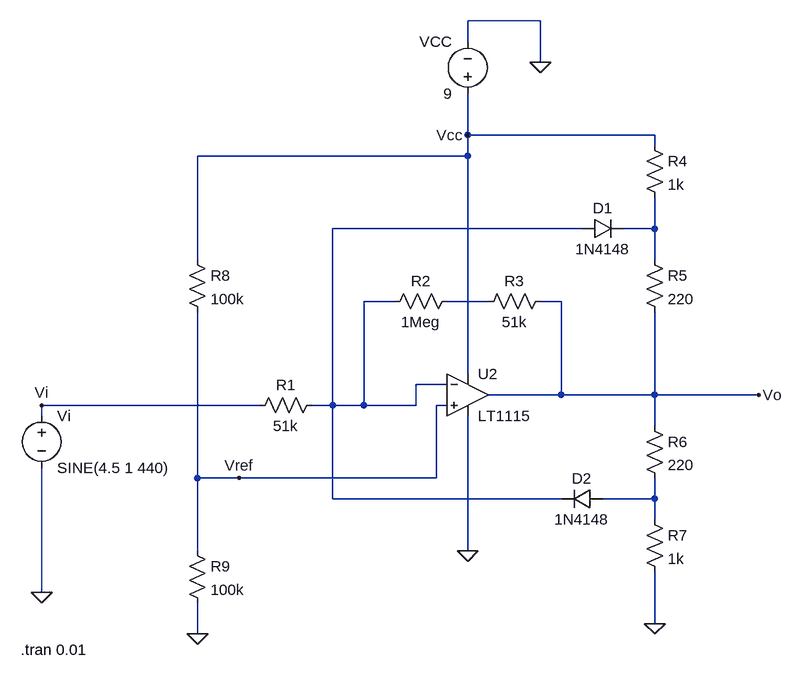
[diagram p0: schematic limiter_amp.asc]
limiter_amp.asc, the LTspice schematic file:
Version 4
SHEET 1 880 680
WIRE 288 -448 176 -448
WIRE 176 -416 176 -448
WIRE 288 -384 288 -448
WIRE 176 -272 176 -336
WIRE 464 -272 176 -272
WIRE 464 -256 464 -272
WIRE 176 -240 176 -272
WIRE 176 -240 -240 -240
WIRE 352 -128 -32 -128
WIRE 464 -128 464 -176
WIRE 464 -128 416 -128
WIRE -240 -80 -240 -240
WIRE 464 -80 464 -128
WIRE 64 -16 16 -16
WIRE 208 -16 144 -16
WIRE 320 -16 288 -16
WIRE 176 96 176 -240
WIRE 144 112 96 112
WIRE 320 128 320 -16
WIRE 320 128 208 128
WIRE 464 128 464 0
WIRE 464 128 320 128
WIRE 624 128 464 128
WIRE -144 144 -480 144
WIRE -32 144 -32 -128
WIRE -32 144 -64 144
WIRE 16 144 16 -16
WIRE 16 144 -32 144
WIRE 96 144 96 112
WIRE 96 144 16 144
WIRE 144 144 128 144
WIRE -480 160 -480 144
WIRE 464 176 464 128
WIRE -240 256 -240 0
WIRE -176 256 -240 256
WIRE 128 256 128 144
WIRE 128 256 -176 256
WIRE -32 288 -32 144
WIRE 320 288 -32 288
WIRE 464 288 464 256
WIRE 464 288 384 288
WIRE 464 320 464 288
WIRE -240 368 -240 256
WIRE 176 368 176 160
WIRE -480 432 -480 240
WIRE 464 480 464 400
WIRE -240 496 -240 448
FLAG 176 368 0
FLAG 288 -384 0
FLAG 464 480 0
FLAG -240 496 0
FLAG -480 144 Vi
FLAG 624 128 Vo
FLAG -176 256 Vref
FLAG 176 -272 Vcc
FLAG -480 432 0
SYMBOL voltage 176 -320 R180
WINDOW 0 24 96 Left 2
WINDOW 3 24 16 Left 2
WINDOW 123 0 0 Left 0
WINDOW 39 0 0 Left 0
SYMATTR InstName VCC
SYMATTR Value 9
SYMBOL res -48 128 R90
WINDOW 0 0 56 VBottom 2
WINDOW 3 32 56 VTop 2
SYMATTR InstName R1
SYMATTR Value 51k
SYMBOL res 160 -32 R90
WINDOW 0 0 56 VBottom 2
WINDOW 3 32 56 VTop 2
SYMATTR InstName R2
SYMATTR Value 1Meg
SYMBOL res 304 -32 R90
WINDOW 0 0 56 VBottom 2
WINDOW 3 32 56 VTop 2
SYMATTR InstName R3
SYMATTR Value 51k
SYMBOL voltage -480 144 R0
WINDOW 123 0 0 Left 0
WINDOW 39 0 0 Left 0
SYMATTR InstName Vi
SYMATTR Value SINE(4.5 1 440)
SYMBOL diode 352 -112 R270
WINDOW 0 32 32 VTop 2
WINDOW 3 0 32 VBottom 2
SYMATTR InstName D1
SYMATTR Value 1N4148
SYMATTR Description Schottky diode
SYMATTR Type schottky
SYMBOL diode 384 272 R90
WINDOW 0 0 32 VBottom 2
WINDOW 3 32 32 VTop 2
SYMATTR InstName D2
SYMATTR Value 1N4148
SYMATTR Description Schottky diode
SYMATTR Type schottky
SYMBOL res 448 -272 R0
SYMATTR InstName R4
SYMATTR Value 1k
SYMBOL res 448 -96 R0
SYMATTR InstName R5
SYMATTR Value 220
SYMBOL res 448 160 R0
SYMATTR InstName R6
SYMATTR Value 220
SYMBOL res 448 304 R0
SYMATTR InstName R7
SYMATTR Value 1k
SYMBOL res -256 -96 R0
SYMATTR InstName R8
SYMATTR Value 100k
SYMBOL res -256 352 R0
SYMATTR InstName R9
SYMATTR Value 100k
SYMBOL OpAmps\\LT1115 176 64 R0
SYMATTR InstName U2
TEXT -512 520 Left 2 !.tran 0.01

The netlist it stands for:
* limiter_amp.asc
VCC Vcc 0 9
R1 N001 Vi 51k
R2 N003 N001 1Meg
R3 Vo N003 51k
Vi Vi 0 SINE(4.5 1 440)
D1 N001 N002 1N4148
D2 N004 N001 1N4148
R4 Vcc N002 1k
R5 N002 Vo 220
R6 Vo N004 220
R7 N004 0 1k
R8 Vcc Vref 100k
R9 Vref 0 100k
XU2 Vref N001 Vcc 0 Vo LT1028  ; LT1115, pins In+ In- V+ V- OUT
.model D D
.lib standard.dio
.tran 0.01
.lib LTC.lib
.backanno
.end